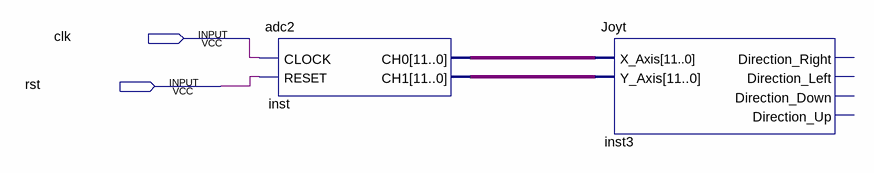
[diagram p0: schematic sheet]
// Quartus schematic PracF.bdf as structural Verilog: 2 symbols, 2 pins
module PracF (
  input  clk,
  input  rst
);

  wire [11:0] inst_ch0, inst_ch1;

  adc2 inst (.CLOCK(clk), .RESET(rst), .CH0(inst_ch0), .CH1(inst_ch1));
  Joyt inst3 (
    .X_Axis(inst_ch0), .Y_Axis(inst_ch1));  // open: Direction_Right, Direction_Left, Direction_Down, Direction_Up
endmodule
